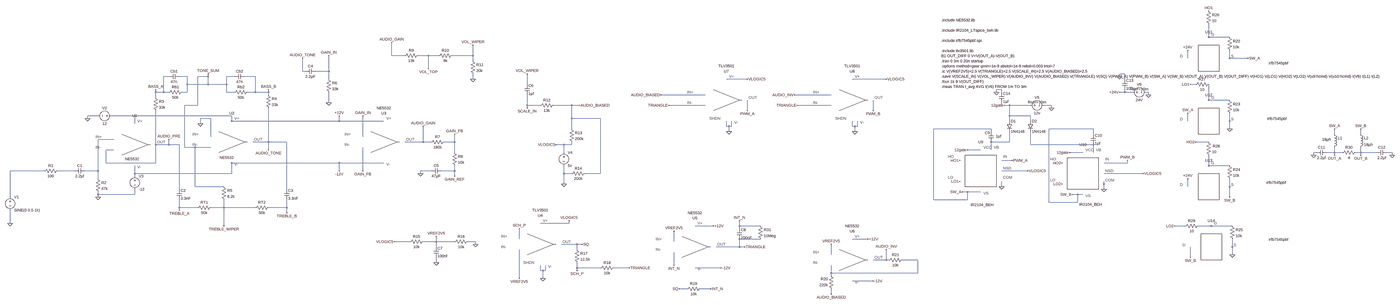
[diagram p0: schematic full amp.asc, whole sheet]
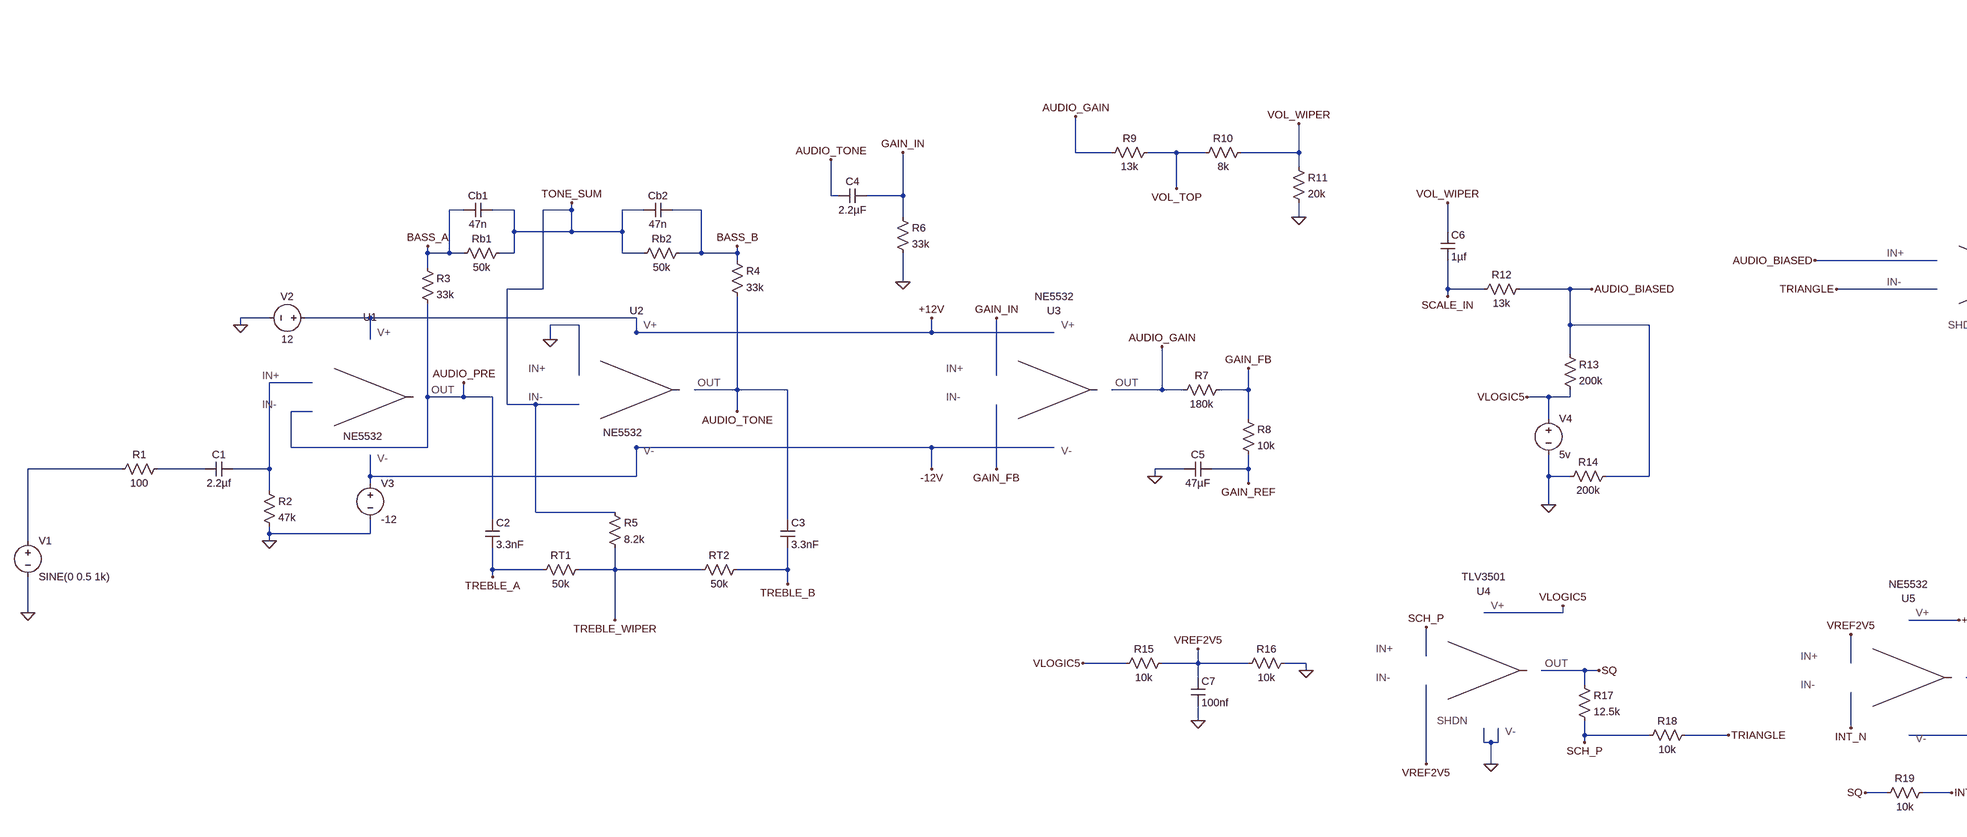
[diagram p1: schematic full amp.asc, part, row 1 of 1, column 1 of 2]
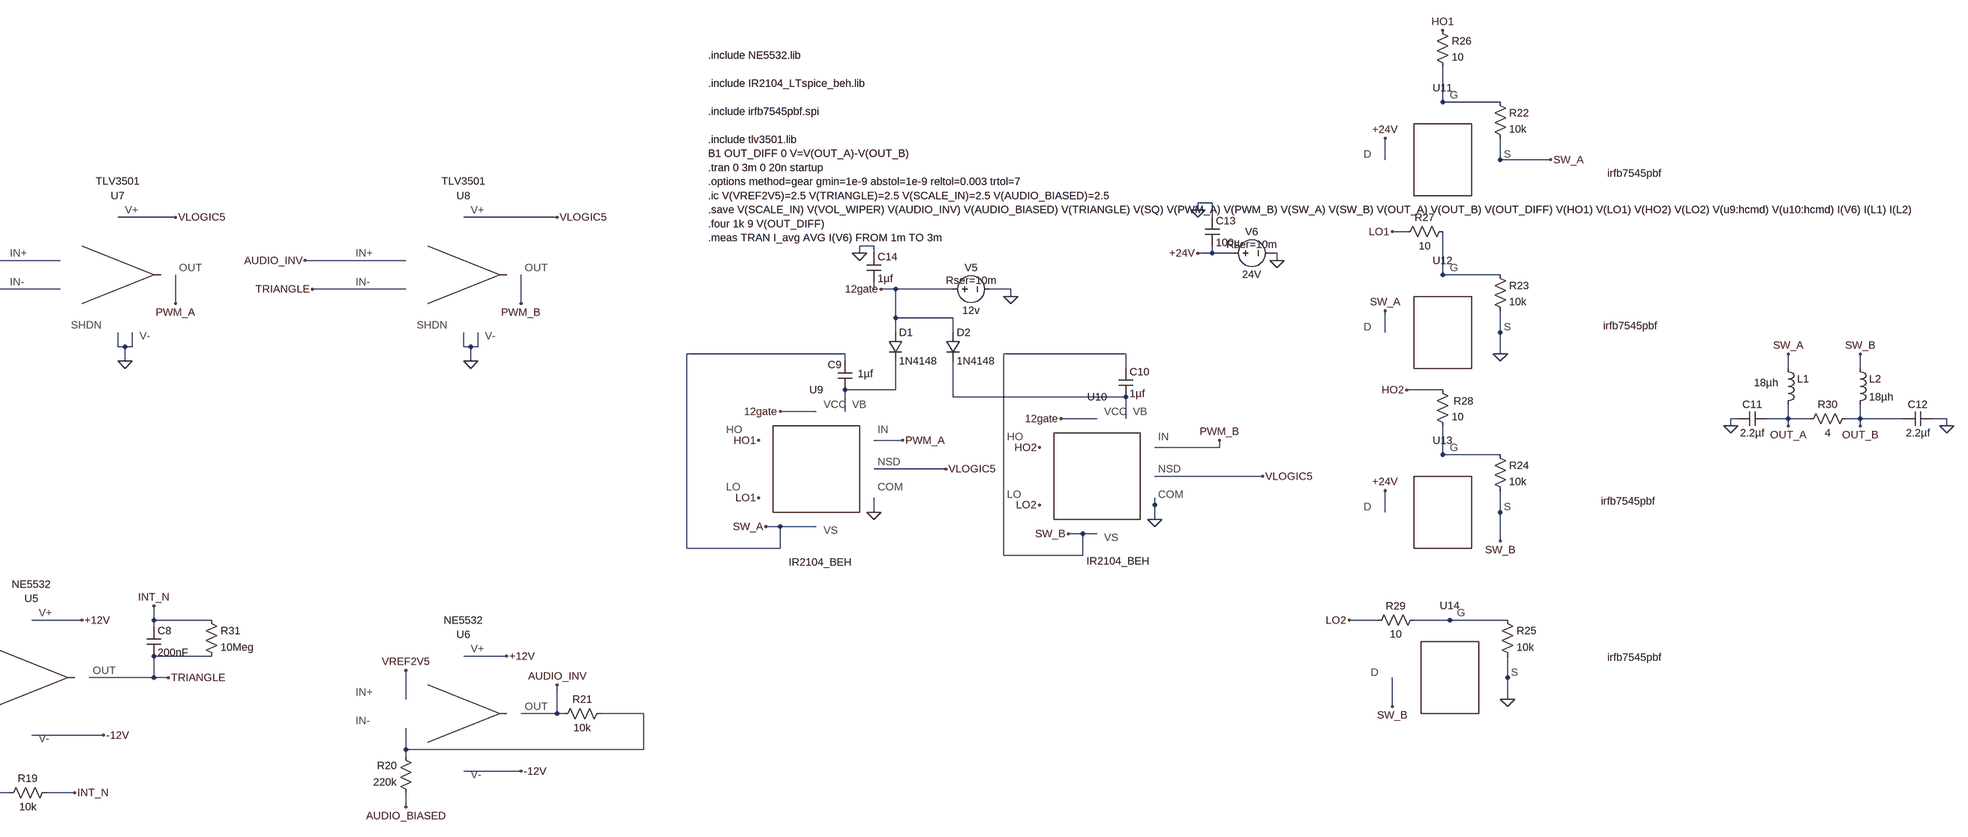
[diagram p2: schematic full amp.asc, part, row 1 of 1, column 2 of 2]
full amp.asc, the LTspice schematic file:
Version 4.1
SHEET 1 8580 772
WIRE 7408 -1040 7408 -1120
WIRE 7536 -1040 7408 -1040
WIRE 2416 -928 2416 -1008
WIRE 2496 -928 2416 -928
WIRE 2640 -928 2576 -928
WIRE 2704 -928 2640 -928
WIRE 2912 -928 2912 -992
WIRE 2912 -928 2784 -928
WIRE 7280 -912 7280 -960
WIRE 7536 -912 7536 -960
WIRE 7648 -912 7536 -912
WIRE 2912 -896 2912 -928
WIRE 2640 -848 2640 -928
WIRE 1872 -832 1872 -912
WIRE 1888 -832 1872 -832
WIRE 2032 -832 2032 -928
WIRE 2032 -832 1952 -832
WIRE 6896 -816 6864 -816
WIRE 1056 -800 1024 -800
WIRE 1168 -800 1120 -800
WIRE 1296 -800 1296 -816
WIRE 1296 -800 1232 -800
WIRE 1456 -800 1408 -800
WIRE 1584 -800 1520 -800
WIRE 6864 -800 6864 -816
WIRE 2032 -784 2032 -832
WIRE 2912 -784 2912 -816
WIRE 4592 -784 4464 -784
WIRE 5440 -784 5232 -784
WIRE 6896 -784 6896 -816
WIRE 1168 -752 1168 -800
WIRE 1296 -752 1296 -800
WIRE 1296 -752 1168 -752
WIRE 1408 -752 1408 -800
WIRE 1408 -752 1296 -752
WIRE 3248 -752 3248 -816
WIRE 7328 -752 7296 -752
WIRE 6144 -720 6112 -720
WIRE 976 -704 976 -720
WIRE 1024 -704 1024 -800
WIRE 1024 -704 976 -704
WIRE 1056 -704 1024 -704
WIRE 1168 -704 1168 -752
WIRE 1168 -704 1136 -704
WIRE 1408 -704 1408 -752
WIRE 1456 -704 1408 -704
WIRE 1584 -704 1584 -800
WIRE 1584 -704 1536 -704
WIRE 1664 -704 1664 -720
WIRE 1664 -704 1584 -704
WIRE 6112 -704 6112 -720
WIRE 6144 -704 6144 -720
WIRE 6896 -704 6896 -720
WIRE 6896 -704 6864 -704
WIRE 6944 -704 6896 -704
WIRE 7040 -704 7024 -704
WIRE 1664 -688 1664 -704
WIRE 4336 -688 4064 -688
WIRE 5104 -688 4880 -688
WIRE 7040 -688 7040 -704
WIRE 976 -672 976 -704
WIRE 7408 -656 7408 -752
WIRE 7536 -656 7408 -656
WIRE 2032 -640 2032 -704
WIRE 1232 -624 1232 -800
WIRE 1232 -624 1152 -624
WIRE 3248 -624 3248 -688
WIRE 3328 -624 3248 -624
WIRE 3520 -624 3408 -624
WIRE 3568 -624 3520 -624
WIRE 4336 -624 4112 -624
WIRE 5104 -624 4896 -624
WIRE 6144 -624 6144 -640
WIRE 6192 -624 6160 -624
WIRE 6320 -624 6192 -624
WIRE 6448 -624 6400 -624
WIRE 3248 -608 3248 -624
WIRE 6448 -608 6448 -624
WIRE 4592 -592 4592 -656
WIRE 5360 -592 5360 -656
WIRE 624 -560 560 -560
WIRE 848 -560 704 -560
WIRE 1440 -560 848 -560
WIRE 6192 -560 6192 -624
WIRE 6320 -560 6192 -560
WIRE 560 -544 560 -560
WIRE 1312 -544 1248 -544
WIRE 3520 -544 3520 -624
WIRE 3696 -544 3520 -544
WIRE 1440 -528 1440 -560
WIRE 2096 -528 2096 -560
WIRE 2096 -528 1440 -528
WIRE 2368 -528 2096 -528
WIRE 6192 -528 6192 -560
WIRE 6320 -528 6320 -560
WIRE 7280 -528 7280 -576
WIRE 7536 -528 7536 -576
WIRE 848 -512 848 -560
WIRE 1248 -512 1248 -544
WIRE 4464 -496 4464 -528
WIRE 4480 -496 4464 -496
WIRE 4496 -496 4496 -528
WIRE 4496 -496 4480 -496
WIRE 5232 -496 5232 -528
WIRE 5248 -496 5232 -496
WIRE 5264 -496 5264 -528
WIRE 5264 -496 5248 -496
WIRE 3520 -480 3520 -544
WIRE 6080 -480 5728 -480
WIRE 6704 -480 6432 -480
WIRE 7536 -480 7536 -528
WIRE 4480 -464 4480 -496
WIRE 5248 -464 5248 -496
WIRE 6080 -464 6080 -480
WIRE 6704 -448 6704 -480
WIRE 8176 -448 8176 -480
WIRE 8336 -448 8336 -480
WIRE 1312 -432 1312 -544
WIRE 2240 -432 2240 -560
WIRE 720 -416 624 -416
WIRE 1664 -400 1664 -608
WIRE 1664 -400 1568 -400
WIRE 1776 -400 1664 -400
WIRE 2608 -400 2608 -496
WIRE 2608 -400 2496 -400
WIRE 2656 -400 2608 -400
WIRE 2800 -400 2800 -448
WIRE 2800 -400 2736 -400
WIRE 6192 -400 6192 -464
WIRE 6192 -400 6080 -400
WIRE 7408 -400 7328 -400
WIRE 976 -384 976 -592
WIRE 1056 -384 1056 -416
WIRE 1056 -384 976 -384
WIRE 1120 -384 1056 -384
WIRE 3472 -384 3424 -384
WIRE 3520 -384 3520 -400
WIRE 3520 -384 3472 -384
WIRE 6320 -384 6320 -464
WIRE 6704 -384 6320 -384
WIRE 1152 -368 1152 -624
WIRE 1216 -368 1152 -368
WIRE 1312 -368 1216 -368
WIRE 720 -352 672 -352
WIRE 1664 -352 1664 -400
WIRE 6016 -352 5936 -352
WIRE 6080 -352 6080 -400
WIRE 2800 -336 2800 -400
WIRE 3472 -336 3472 -384
WIRE 6640 -336 6560 -336
WIRE 6704 -336 6704 -384
WIRE 8064 -336 8048 -336
WIRE 8176 -336 8176 -368
WIRE 8176 -336 8128 -336
WIRE 8224 -336 8176 -336
WIRE 8336 -336 8336 -368
WIRE 8336 -336 8304 -336
WIRE 8432 -336 8336 -336
WIRE 8528 -336 8496 -336
WIRE 8048 -320 8048 -336
WIRE 8176 -320 8176 -336
WIRE 8336 -320 8336 -336
WIRE 8528 -320 8528 -336
WIRE 6208 -288 6144 -288
WIRE 672 -272 672 -352
WIRE 976 -272 976 -384
WIRE 976 -272 672 -272
WIRE 2096 -272 1440 -272
WIRE 2368 -272 2096 -272
WIRE 6912 -272 6912 -288
WIRE 6912 -272 6768 -272
WIRE 7408 -256 7408 -320
WIRE 7536 -256 7408 -256
WIRE 272 -224 64 -224
WIRE 480 -224 352 -224
WIRE 624 -224 624 -416
WIRE 624 -224 544 -224
WIRE 2096 -224 2096 -272
WIRE 2240 -224 2240 -368
WIRE 2656 -224 2592 -224
WIRE 2800 -224 2800 -256
WIRE 2800 -224 2720 -224
WIRE 6304 -224 6144 -224
WIRE 848 -208 848 -256
WIRE 1440 -208 1440 -272
WIRE 1440 -208 848 -208
WIRE 2592 -208 2592 -224
WIRE 3472 -208 3472 -256
WIRE 3520 -208 3472 -208
WIRE 3696 -208 3696 -544
WIRE 3696 -208 3600 -208
WIRE 7008 -208 6768 -208
WIRE 848 -192 848 -208
WIRE 2800 -192 2800 -224
WIRE 624 -176 624 -224
WIRE 3472 -144 3472 -208
WIRE 6768 -144 6768 -160
WIRE 1216 -128 1216 -368
WIRE 1392 -128 1216 -128
WIRE 6144 -128 6144 -160
WIRE 7280 -128 7280 -176
WIRE 7536 -128 7536 -176
WIRE 1120 -112 1120 -384
WIRE 1776 -112 1776 -400
WIRE 6768 -112 6768 -144
WIRE 5936 -96 5904 -96
WIRE 6016 -96 5936 -96
WIRE 624 -80 624 -96
WIRE 848 -80 848 -112
WIRE 848 -80 624 -80
WIRE 6608 -80 6576 -80
WIRE 6640 -80 6608 -80
WIRE 64 -64 64 -224
WIRE 624 -64 624 -80
WIRE 7536 -64 7536 -128
WIRE 5728 -48 5728 -480
WIRE 5936 -48 5936 -96
WIRE 5936 -48 5728 -48
WIRE 6432 -32 6432 -480
WIRE 6608 -32 6608 -80
WIRE 6608 -32 6432 -32
WIRE 1120 0 1120 -48
WIRE 1232 0 1120 0
WIRE 1392 0 1392 -48
WIRE 1392 0 1312 0
WIRE 1584 0 1392 0
WIRE 1776 0 1776 -48
WIRE 1776 0 1664 0
WIRE 1120 16 1120 0
WIRE 1776 32 1776 0
WIRE 64 96 64 16
WIRE 3504 96 3504 80
WIRE 3504 96 3328 96
WIRE 1392 112 1392 0
WIRE 4384 112 4272 112
WIRE 4544 112 4544 80
WIRE 4672 112 4544 112
WIRE 7264 112 7200 112
WIRE 7424 112 7344 112
WIRE 7552 112 7424 112
WIRE 4544 128 4544 112
WIRE 3200 192 3200 128
WIRE 4672 192 4544 192
WIRE 5328 192 5232 192
WIRE 2528 208 2432 208
WIRE 2688 208 2688 176
WIRE 2688 208 2608 208
WIRE 2800 208 2688 208
WIRE 2928 208 2880 208
WIRE 4144 208 4144 144
WIRE 2928 224 2928 208
WIRE 3552 224 3456 224
WIRE 3584 224 3552 224
WIRE 2688 240 2688 208
WIRE 4544 240 4544 192
WIRE 4544 240 4400 240
WIRE 4576 240 4544 240
WIRE 7552 240 7552 192
WIRE 3552 256 3552 224
WIRE 5104 288 5104 224
WIRE 7552 288 7552 240
WIRE 7296 304 7296 240
WIRE 5440 320 5440 256
WIRE 5440 320 5360 320
WIRE 5456 320 5440 320
WIRE 5632 320 5536 320
WIRE 2688 336 2688 304
WIRE 4144 352 4144 272
WIRE 3552 368 3552 336
WIRE 3696 368 3552 368
WIRE 3872 368 3776 368
WIRE 4432 368 4272 368
WIRE 3328 384 3328 352
WIRE 3344 384 3328 384
WIRE 3360 384 3360 352
WIRE 3360 384 3344 384
WIRE 3552 384 3552 368
WIRE 5104 400 5104 352
WIRE 5632 400 5632 320
WIRE 5632 400 5104 400
WIRE 5104 416 5104 400
WIRE 3200 432 3200 256
WIRE 3344 432 3344 384
WIRE 5360 448 5232 448
WIRE 4224 496 4176 496
WIRE 4368 496 4304 496
WIRE 5104 528 5104 496
FLAG 624 -64 0
FLAG 560 -544 0
FLAG 64 96 0
FLAG 1248 -512 0
FLAG 1664 -720 BASS_B
FLAG 976 -720 BASS_A
FLAG 1296 -816 TONE_SUM
FLAG 1120 16 TREBLE_A
FLAG 1776 32 TREBLE_B
FLAG 1392 112 TREBLE_WIPER
FLAG 1056 -416 AUDIO_PRE
FLAG 1664 -352 AUDIO_TONE
FLAG 1872 -912 AUDIO_TONE
FLAG 2032 -928 GAIN_IN
FLAG 2032 -640 0
FLAG 2800 -448 GAIN_FB
FLAG 2800 -192 GAIN_REF
FLAG 2592 -208 0
FLAG 2240 -224 GAIN_FB
FLAG 2240 -560 GAIN_IN
FLAG 2608 -496 AUDIO_GAIN
FLAG 2416 -1008 AUDIO_GAIN
FLAG 2640 -848 VOL_TOP
FLAG 2912 -992 VOL_WIPER
FLAG 2912 -784 0
FLAG 3248 -816 VOL_WIPER
FLAG 3248 -608 SCALE_IN
FLAG 3568 -624 AUDIO_BIASED
FLAG 3424 -384 VLOGIC5
FLAG 3472 -144 0
FLAG 2432 208 VLOGIC5
FLAG 2688 176 VREF2V5
FLAG 2928 224 0
FLAG 2688 336 0
FLAG 3344 432 0
FLAG 3200 432 VREF2V5
FLAG 3200 128 SCH_P
FLAG 3584 224 SQ
FLAG 3552 384 SCH_P
FLAG 3872 368 TRIANGLE
FLAG 4144 144 VREF2V5
FLAG 2096 -560 +12V
FLAG 2096 -224 -12V
FLAG 4384 112 +12V
FLAG 4432 368 -12V
FLAG 4576 240 TRIANGLE
FLAG 4144 352 INT_N
FLAG 4176 496 SQ
FLAG 4368 496 INT_N
FLAG 4544 80 INT_N
FLAG 3504 80 VLOGIC5
FLAG 5104 528 AUDIO_BIASED
FLAG 5104 224 VREF2V5
FLAG 5328 192 +12V
FLAG 5360 448 -12V
FLAG 5440 256 AUDIO_INV
FLAG 4112 -624 TRIANGLE
FLAG 4064 -688 AUDIO_BIASED
FLAG 4896 -624 TRIANGLE
FLAG 4880 -688 AUDIO_INV
FLAG 4592 -784 VLOGIC5
FLAG 5440 -784 VLOGIC5
FLAG 4480 -464 0
FLAG 5248 -464 0
FLAG 4592 -592 PWM_A
FLAG 5360 -592 PWM_B
FLAG 6144 -128 0
FLAG 6768 -112 0
FLAG 6208 -288 PWM_A
FLAG 6912 -288 PWM_B
FLAG 6160 -624 12gate
FLAG 6448 -608 0
FLAG 5936 -352 12gate
FLAG 6560 -336 12gate
FLAG 5904 -96 SW_A
FLAG 6576 -80 SW_B
FLAG 6304 -224 VLOGIC5
FLAG 7008 -208 VLOGIC5
FLAG 6864 -704 +24V
FLAG 5888 -288 HO1
FLAG 5888 -160 LO1
FLAG 6512 -272 HO2
FLAG 6512 -144 LO2
FLAG 7040 -688 0
FLAG 7280 -960 +24V
FLAG 7648 -912 SW_A
FLAG 7408 -1200 HO1
FLAG 7280 -576 SW_A
FLAG 7536 -480 0
FLAG 7296 -752 LO1
FLAG 7280 -176 +24V
FLAG 7536 -64 SW_B
FLAG 7328 -400 HO2
FLAG 7296 304 SW_B
FLAG 7552 288 0
FLAG 7200 112 LO2
FLAG 8176 -480 SW_A
FLAG 8336 -480 SW_B
FLAG 8176 -320 OUT_A
FLAG 8336 -320 OUT_B
FLAG 8048 -320 0
FLAG 8528 -320 0
FLAG 6864 -800 0
FLAG 6112 -704 0
SYMBOL voltage 64 -80 R0
WINDOW 123 0 0 Left 0
WINDOW 39 0 0 Left 0
SYMATTR InstName V1
SYMATTR Value SINE(0 0.5 1k)
SYMBOL res 368 -240 R90
WINDOW 0 0 56 VBottom 2
WINDOW 3 32 56 VTop 2
SYMATTR InstName R1
SYMATTR Value 100
SYMATTR SpiceLine tol=1 pwr=0.125
SYMBOL cap 544 -240 R90
WINDOW 0 0 32 VBottom 2
WINDOW 3 32 32 VTop 2
SYMATTR InstName C1
SYMATTR Value 2.2µf
SYMATTR SpiceLine V=25
SYMBOL res 608 -192 R0
SYMATTR InstName R2
SYMATTR Value 47k
SYMATTR SpiceLine tol=1 pwr=0.125
SYMBOL NE5532 848 -384 R0
WINDOW 0 0 -162 Bottom 2
WINDOW 3 -16 87 Center 2
SYMATTR InstName U1
SYMBOL voltage 720 -560 R90
WINDOW 0 -32 56 VBottom 2
WINDOW 3 32 56 VTop 2
WINDOW 123 0 0 Left 0
WINDOW 39 0 0 Left 0
SYMATTR InstName V2
SYMATTR Value 12
SYMBOL voltage 848 -208 R0
WINDOW 123 0 0 Left 0
WINDOW 39 0 0 Left 0
SYMATTR InstName V3
SYMATTR Value -12
SYMBOL NE5532 1440 -400 R0
WINDOW 3 -31 95 Center 2
SYMATTR InstName U2
SYMBOL res 960 -688 R0
SYMATTR InstName R3
SYMATTR Value 33k
SYMBOL res 1648 -704 R0
SYMATTR InstName R4
SYMATTR Value 33k
SYMBOL res 1152 -720 R90
WINDOW 0 0 56 VBottom 2
WINDOW 3 32 56 VTop 2
SYMATTR InstName Rb1
SYMATTR Value 50k
SYMBOL cap 1120 -816 R90
WINDOW 0 0 32 VBottom 2
WINDOW 3 32 32 VTop 2
SYMATTR InstName Cb1
SYMATTR Value 47n
SYMBOL res 1552 -720 R90
WINDOW 0 0 56 VBottom 2
WINDOW 3 32 56 VTop 2
SYMATTR InstName Rb2
SYMATTR Value 50k
SYMBOL cap 1520 -816 R90
WINDOW 0 0 32 VBottom 2
WINDOW 3 32 32 VTop 2
SYMATTR InstName Cb2
SYMATTR Value 47n
SYMBOL cap 1104 -112 R0
SYMATTR InstName C2
SYMATTR Value 3.3nF
SYMBOL cap 1760 -112 R0
SYMATTR InstName C3
SYMATTR Value 3.3nF
SYMBOL res 1328 -16 R90
WINDOW 0 0 56 VBottom 2
WINDOW 3 32 56 VTop 2
SYMATTR InstName RT1
SYMATTR Value 50k
SYMBOL res 1680 -16 R90
WINDOW 0 0 56 VBottom 2
WINDOW 3 32 56 VTop 2
SYMATTR InstName RT2
SYMATTR Value 50k
SYMBOL res 1376 -144 R0
SYMATTR InstName R5
SYMATTR Value 8.2k
SYMBOL cap 1952 -848 R90
WINDOW 0 0 32 VBottom 2
WINDOW 3 32 32 VTop 2
SYMATTR InstName C4
SYMATTR Value 2.2µF
SYMBOL res 2016 -800 R0
SYMATTR InstName R6
SYMATTR Value 33k
SYMBOL NE5532 2368 -400 R0
SYMATTR InstName U3
SYMBOL res 2752 -416 R90
WINDOW 0 0 56 VBottom 2
WINDOW 3 32 56 VTop 2
SYMATTR InstName R7
SYMATTR Value 180k
SYMBOL res 2784 -352 R0
SYMATTR InstName R8
SYMATTR Value 10k
SYMBOL cap 2720 -240 R90
WINDOW 0 0 32 VBottom 2
WINDOW 3 32 32 VTop 2
SYMATTR InstName C5
SYMATTR Value 47µF
SYMBOL res 2592 -944 R90
WINDOW 0 0 56 VBottom 2
WINDOW 3 32 56 VTop 2
SYMATTR InstName R9
SYMATTR Value 13k
SYMBOL res 2800 -944 R90
WINDOW 0 0 56 VBottom 2
WINDOW 3 32 56 VTop 2
SYMATTR InstName R10
SYMATTR Value 8k
SYMBOL res 2896 -912 R0
SYMATTR InstName R11
SYMATTR Value 20k
SYMBOL cap 3232 -752 R0
SYMATTR InstName C6
SYMATTR Value 1µf
SYMBOL res 3424 -640 R90
WINDOW 0 0 56 VBottom 2
WINDOW 3 32 56 VTop 2
SYMATTR InstName R12
SYMATTR Value 13k
SYMBOL res 3504 -496 R0
SYMATTR InstName R13
SYMATTR Value 200k
SYMBOL voltage 3472 -352 R0
WINDOW 123 0 0 Left 0
WINDOW 39 0 0 Left 0
SYMATTR InstName V4
SYMATTR Value 5v
SYMBOL res 3616 -224 R90
WINDOW 0 0 56 VBottom 2
WINDOW 3 32 56 VTop 2
SYMATTR InstName R14
SYMATTR Value 200k
SYMBOL res 2624 192 R90
WINDOW 0 0 56 VBottom 2
WINDOW 3 32 56 VTop 2
SYMATTR InstName R15
SYMATTR Value 10k
SYMBOL res 2896 192 R90
WINDOW 0 0 56 VBottom 2
WINDOW 3 32 56 VTop 2
SYMATTR InstName R16
SYMATTR Value 10k
SYMBOL cap 2672 240 R0
SYMATTR InstName C7
SYMATTR Value 100nf
SYMBOL TLV3501 3328 224 R0
SYMATTR InstName U4
SYMBOL res 3536 240 R0
SYMATTR InstName R17
SYMATTR Value 12.5k
SYMBOL res 3792 352 R90
WINDOW 0 0 56 VBottom 2
WINDOW 3 32 56 VTop 2
SYMATTR InstName R18
SYMATTR Value 10k
SYMBOL NE5532 4272 240 R0
SYMATTR InstName U5
SYMBOL res 4320 480 R90
WINDOW 0 0 56 VBottom 2
WINDOW 3 32 56 VTop 2
SYMATTR InstName R19
SYMATTR Value 10k
SYMBOL cap 4528 128 R0
SYMATTR InstName C8
SYMATTR Value 200nF
SYMBOL NE5532 5232 320 R0
SYMATTR InstName U6
SYMBOL res 5120 512 R180
WINDOW 0 36 76 Left 2
WINDOW 3 36 40 Left 2
SYMATTR InstName R20
SYMATTR Value 220k
SYMBOL res 5552 304 R90
WINDOW 0 0 56 VBottom 2
WINDOW 3 32 56 VTop 2
SYMATTR InstName R21
SYMATTR Value 10k
SYMBOL TLV3501 4464 -656 R0
SYMATTR InstName U7
SYMBOL TLV3501 5232 -656 R0
SYMATTR InstName U8
SYMBOL IR2104_BEH 6016 -224 R0
WINDOW 3 9 207 Center 2
SYMATTR InstName U9
SYMBOL IR2104_BEH 6640 -208 R0
WINDOW 3 47 189 Center 2
SYMATTR InstName U10
SYMBOL voltage 6304 -624 R270
WINDOW 0 32 56 VTop 2
WINDOW 3 -32 56 VBottom 2
WINDOW 123 0 0 Left 0
WINDOW 39 4 56 VTop 2
SYMATTR InstName V5
SYMATTR Value 12v
SYMATTR SpiceLine Rser=10m
SYMBOL cap 6096 -400 R180
WINDOW 0 24 56 Left 2
WINDOW 3 -46 36 Left 2
SYMATTR InstName C9
SYMATTR Value 1µf
SYMBOL cap 6688 -448 R0
SYMATTR InstName C10
SYMATTR Value 1µf
SYMBOL diode 6176 -528 R0
SYMATTR InstName D1
SYMATTR Value 1N4148
SYMBOL diode 6304 -528 R0
SYMATTR InstName D2
SYMATTR Value 1N4148
SYMBOL IRFB7545 7408 -912 R0
WINDOW 3 427 30 Center 2
SYMATTR InstName U11
SYMBOL IRFB7545 7408 -528 R0
WINDOW 3 418 -15 Center 2
SYMATTR InstName U12
SYMBOL IRFB7545 7408 -128 R0
WINDOW 3 413 -25 Center 2
SYMATTR InstName U13
SYMBOL IRFB7545 7424 240 R0
WINDOW 3 411 -45 Center 2
SYMATTR InstName U14
SYMBOL voltage 6928 -704 R270
WINDOW 0 32 56 VTop 2
WINDOW 3 -32 56 VBottom 2
WINDOW 123 0 0 Left 0
WINDOW 39 4 56 VTop 2
SYMATTR InstName V6
SYMATTR Value 24V
SYMATTR SpiceLine Rser=10m
SYMBOL res 7520 -1056 R0
SYMATTR InstName R22
SYMATTR Value 10k
SYMBOL res 7520 -672 R0
SYMATTR InstName R23
SYMATTR Value 10k
SYMBOL res 7520 -272 R0
SYMATTR InstName R24
SYMATTR Value 10k
SYMBOL res 7536 96 R0
SYMATTR InstName R25
SYMATTR Value 10k
SYMBOL res 7392 -1216 R0
SYMATTR InstName R26
SYMATTR Value 10
SYMBOL res 7424 -768 R90
WINDOW 0 0 56 VBottom 2
WINDOW 3 32 56 VTop 2
SYMATTR InstName R27
SYMATTR Value 10
SYMBOL res 7392 -416 R0
WINDOW 0 40 41 Left 2
SYMATTR InstName R28
SYMATTR Value 10
SYMBOL res 7360 96 R90
WINDOW 0 0 56 VBottom 2
WINDOW 3 32 56 VTop 2
SYMATTR InstName R29
SYMATTR Value 10
SYMBOL ind 8160 -464 R0
WINDOW 3 -60 48 Left 2
SYMATTR Value 18µh
SYMATTR InstName L1
SYMATTR SpiceLine Rser=10m Rpar=5k
SYMBOL ind 8320 -464 R0
SYMATTR InstName L2
SYMATTR Value 18µh
SYMATTR SpiceLine Rser=10m Rpar=5k
SYMBOL cap 8128 -352 R90
WINDOW 0 0 32 VBottom 2
WINDOW 3 32 32 VTop 2
SYMATTR InstName C11
SYMATTR Value 2.2µf
SYMBOL cap 8496 -352 R90
WINDOW 0 0 32 VBottom 2
WINDOW 3 32 32 VTop 2
SYMATTR InstName C12
SYMATTR Value 2.2µf
SYMBOL res 8320 -352 R90
WINDOW 0 0 56 VBottom 2
WINDOW 3 32 56 VTop 2
SYMATTR InstName R30
SYMATTR Value 4
SYMBOL res 4656 96 R0
SYMATTR InstName R31
SYMATTR Value 10Meg
SYMBOL cap 6880 -784 R0
SYMATTR InstName C13
SYMATTR Value 100µ
SYMATTR SpiceLine Rser=20m
SYMBOL cap 6128 -704 R0
SYMATTR InstName C14
SYMATTR Value 1µf
TEXT 5776 -1144 Left 2 !.include NE5532.lib\n \n.include IR2104_LTspice_beh.lib\n \n.include irfb7545pbf.spi\n \n.include tlv3501.lib\nB1 OUT_DIFF 0 V=V(OUT_A)-V(OUT_B)\n.tran 0 3m 0 20n startup\n.options method=gear gmin=1e-9 abstol=1e-9 reltol=0.003 trtol=7\n.ic V(VREF2V5)=2.5 V(TRIANGLE)=2.5 V(SCALE_IN)=2.5 V(AUDIO_BIASED)=2.5\n.save V(SCALE_IN) V(VOL_WIPER) V(AUDIO_INV) V(AUDIO_BIASED) V(TRIANGLE) V(SQ) V(PWM_A) V(PWM_B) V(SW_A) V(SW_B) V(OUT_A) V(OUT_B) V(OUT_DIFF) V(HO1) V(LO1) V(HO2) V(LO2) V(u9:hcmd) V(u10:hcmd) I(V6) I(L1) I(L2)\n.four 1k 9 V(OUT_DIFF)\n.meas TRAN I_avg AVG I(V6) FROM 1m TO 3m

The netlist it stands for:
* full amp.asc
V1 N008 0 SINE(0 0.5 1k)
R1 N009 N008 100 tol=1 pwr=0.125
C1 N004 N009 2.2µf V=25
R2 N004 0 47k tol=1 pwr=0.125
X§U1 N004 AUDIO_PRE +12V -12V AUDIO_PRE NE5532  ; pins IN+ IN- V+ V- OUT
V2 +12V 0 12
V3 -12V 0 -12
X§U2 0 TONE_SUM +12V -12V AUDIO_TONE NE5532  ; pins IN+ IN- V+ V- OUT
R3 BASS_A AUDIO_PRE 33k
R4 BASS_B AUDIO_TONE 33k
Rb1 TONE_SUM BASS_A 50k
Cb1 TONE_SUM BASS_A 47n
Rb2 BASS_B TONE_SUM 50k
Cb2 BASS_B TONE_SUM 47n
C2 AUDIO_PRE TREBLE_A 3.3nF
C3 AUDIO_TONE TREBLE_B 3.3nF
RT1 TREBLE_WIPER TREBLE_A 50k
RT2 TREBLE_B TREBLE_WIPER 50k
R5 TONE_SUM TREBLE_WIPER 8.2k
C4 GAIN_IN AUDIO_TONE 2.2µF
R6 GAIN_IN 0 33k
X§U3 GAIN_IN GAIN_FB +12V -12V AUDIO_GAIN NE5532  ; pins IN+ IN- V+ V- OUT
R7 GAIN_FB AUDIO_GAIN 180k
R8 GAIN_FB GAIN_REF 10k
C5 GAIN_REF 0 47µF
R9 VOL_TOP AUDIO_GAIN 13k
R10 VOL_WIPER VOL_TOP 8k
R11 VOL_WIPER 0 20k
C6 VOL_WIPER SCALE_IN 1µf
R12 AUDIO_BIASED SCALE_IN 13k
R13 AUDIO_BIASED VLOGIC5 200k
V4 VLOGIC5 0 5v
R14 AUDIO_BIASED 0 200k
R15 VREF2V5 VLOGIC5 10k
R16 0 VREF2V5 10k
C7 VREF2V5 0 100nf
X§U4 SCH_P VREF2V5 0 VLOGIC5 0 SQ TLV3501  ; pins IN+ IN- SHDN V+ V- OUT
R17 SQ SCH_P 12.5k
R18 TRIANGLE SCH_P 10k
X§U5 VREF2V5 INT_N +12V -12V TRIANGLE NE5532  ; pins IN+ IN- V+ V- OUT
R19 INT_N SQ 10k
C8 INT_N TRIANGLE 200nF
X§U6 VREF2V5 N011 +12V -12V AUDIO_INV NE5532  ; pins IN+ IN- V+ V- OUT
R20 AUDIO_BIASED N011 220k
R21 N011 AUDIO_INV 10k
X§U7 AUDIO_BIASED TRIANGLE 0 VLOGIC5 0 PWM_A TLV3501  ; pins IN+ IN- SHDN V+ V- OUT
X§U8 AUDIO_INV TRIANGLE 0 VLOGIC5 0 PWM_B TLV3501  ; pins IN+ IN- SHDN V+ V- OUT
X§U9 LO1 HO1 0 PWM_A 12gate N005 SW_A VLOGIC5 IR2104_BEH  ; pins LO HO COM IN VCC VB VS NSD
X§U10 LO2 HO2 0 PWM_B 12gate N006 SW_B VLOGIC5 IR2104_BEH  ; pins LO HO COM IN VCC VB VS NSD
V5 12gate 0 12v Rser=10m
C9 N005 SW_A 1µf
C10 SW_B N006 1µf
D1 12gate N005 1N4148
D2 12gate N006 1N4148
X§U11 +24V N001 SW_A irfb7545pbf  ; pins D G S
X§U12 SW_A N002 0 irfb7545pbf  ; pins D G S
X§U13 +24V N007 SW_B irfb7545pbf  ; pins D G S
X§U14 SW_B N010 0 irfb7545pbf  ; pins D G S
V6 +24V 0 24V Rser=10m
R22 N001 SW_A 10k
R23 N002 0 10k
R24 N007 SW_B 10k
R25 N010 0 10k
R26 HO1 N001 10
R27 N002 LO1 10
R28 HO2 N007 10
R29 N010 LO2 10
L1 SW_A OUT_A 18µh Rser=10m Rpar=5k
L2 SW_B OUT_B 18µh Rser=10m Rpar=5k
C11 OUT_A 0 2.2µf
C12 0 OUT_B 2.2µf
R30 OUT_B OUT_A 4
R31 INT_N TRIANGLE 10Meg
C13 0 +24V 100µ Rser=20m
C14 0 N003 1µf
.model D D
.lib standard.dio
.include NE5532.lib
.include IR2104_LTspice_beh.lib
.include irfb7545pbf.spi
.include tlv3501.lib
B1 OUT_DIFF 0 V=V(OUT_A)-V(OUT_B)
.tran 0 3m 0 20n startup
.options method=gear gmin=1e-9 abstol=1e-9 reltol=0.003 trtol=7
.ic V(VREF2V5)=2.5 V(TRIANGLE)=2.5 V(SCALE_IN)=2.5 V(AUDIO_BIASED)=2.5
.save V(SCALE_IN) V(VOL_WIPER) V(AUDIO_INV) V(AUDIO_BIASED) V(TRIANGLE) V(SQ) V(PWM_A) V(PWM_B) V(SW_A) V(SW_B) V(OUT_A) V(OUT_B) V(OUT_DIFF) V(HO1) V(LO1) V(HO2) V(LO2) V(u9:hcmd) V(u10:hcmd) I(V6) I(L1) I(L2)
.four 1k 9 V(OUT_DIFF)
.meas TRAN I_avg AVG I(V6) FROM 1m TO 3m
.backanno
.end